# Altium project Remote_Sensor_Unit-v1.0.PrjPcb (part 4 of 4)

## Sheet Controller_Sheet.SchDoc
size 420 x 297 mm; SheetNumber: 5; SheetTotal: 7
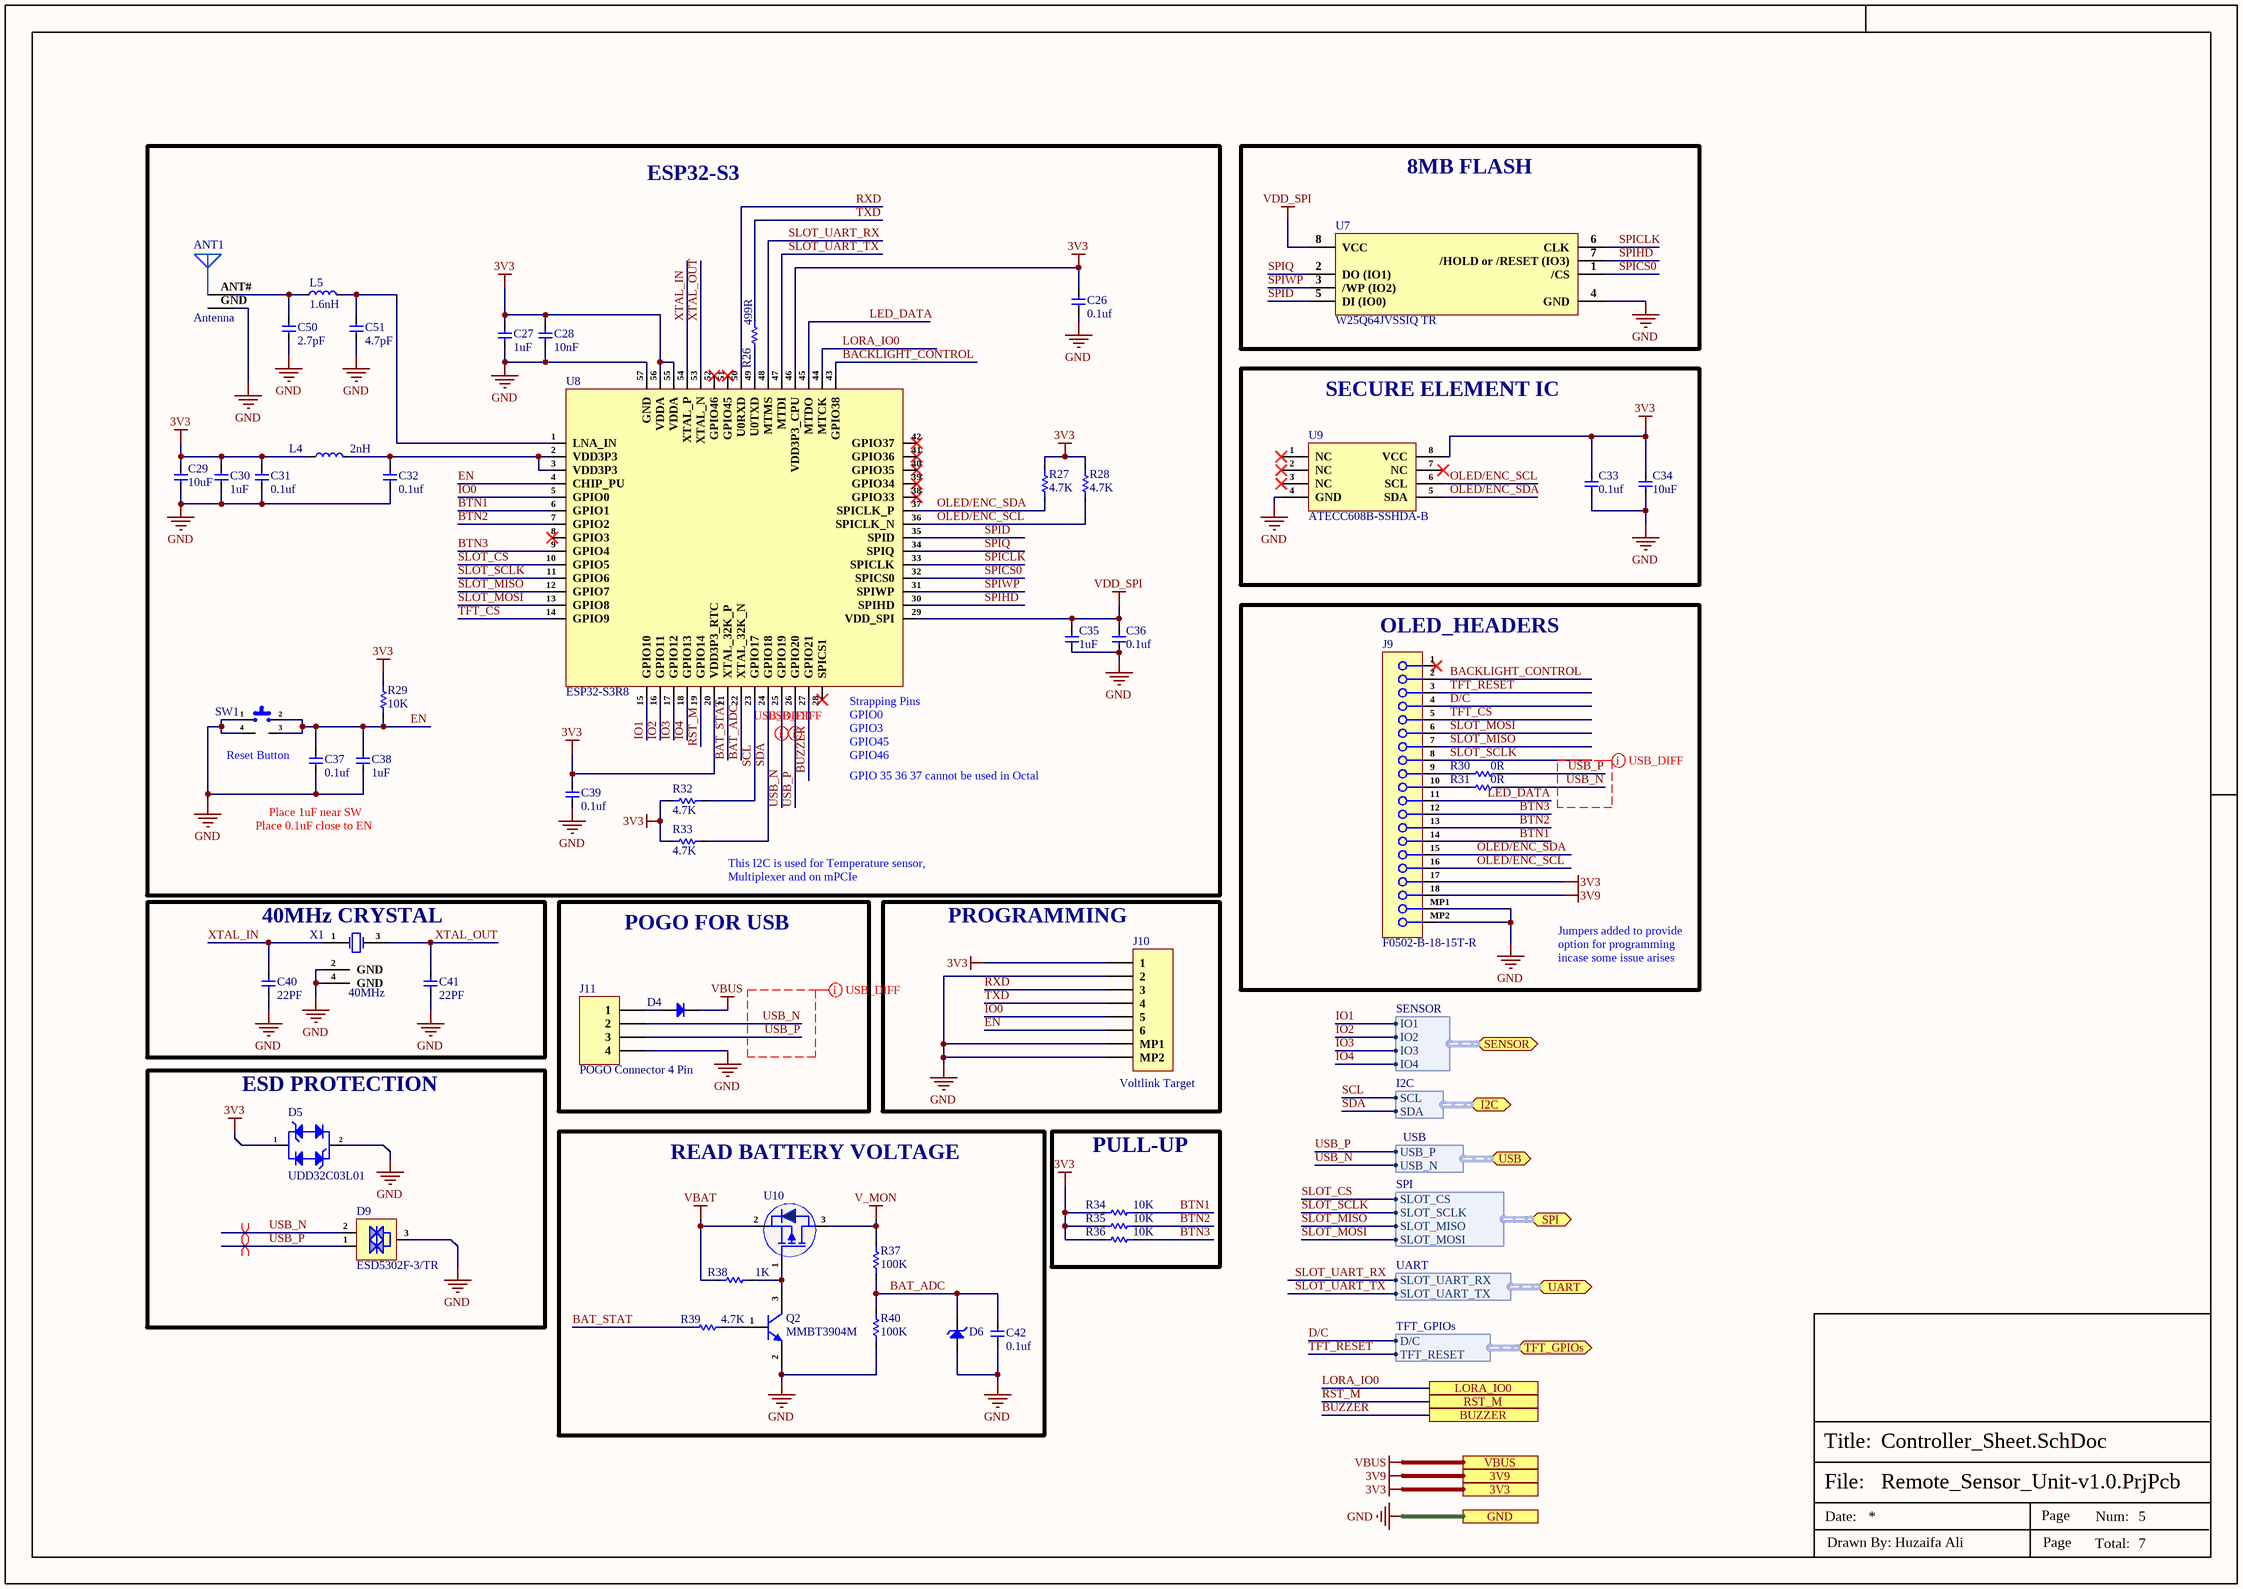
[diagram p6: Controller_Sheet.SchDoc]

### Parts
ANT1  Antenna  [ANT*]  (net tie)
C26  0.1uf  [Cap-0402]
C27  1uF  [Cap-0402]
C28  10nF  [Cap-0402]
C29  10uF  [Cap-0402]
C30  1uF  [Cap-0402]
C31  0.1uf  [Cap-0402]
C32  0.1uf  [Cap-0402]
C33  0.1uf  [Cap-0402]
C34  10uF  [Cap-0402]
C35  1uF  [Cap-0402]
C36  0.1uf  [Cap-0402]
C37  0.1uf  [Cap-0402]
C38  1uF  [Cap-0402]
C39  0.1uf  [Cap-0402]
C40  22PF  [Cap-0402]
C41  22PF  [Cap-0402]
C42  0.1uf  [Cap-0402]
C50  2.7pF  [CAP-0201]
C51  4.7pF  [CAP-0201]
D4  1N4148WS-7-F  [SOD-323]  (value not drawn)
D5  UDD32C03L01  [SOD-323]
D6  MM3Z3V3B  [SOD323F]  (value not drawn)
D9  ESD5302F-3/TR  [Sot-23]
J9  F0502-B-18-15T-R  [F0502-B-18-15T-R]
J10  Voltlink Target  [Voltlink Target]
J11  POGO Connector 4 Pin  [Pogo 4 Pin]
L4  2nH  [IND-0603 (1608 Metric)]
L5  1.6nH  [IND-0603 (1608 Metric)]
Q2  MMBT3904M  [SOT-723]
R26  499R  [Res-0402]
R27  4.7K  [Res-0402]
R28  4.7K  [Res-0402]
R29  10K  [Res-0201]
R30  0R  [Res-0402]
R31  0R  [Res-0402]
R32  4.7K  [Res-0402]
R33  4.7K  [Res-0402]
R34  10K  [Res-0201]
R35  10K  [Res-0201]
R36  10K  [Res-0201]
R37  100K  [Res-0603]
R38  1K  [Res-0201]
R39  4.7K  [Res-0402]
R40  100K  [Res-0603]
SW1  1825027-8  [1825027-8]  (value not drawn)
U7  W25Q64JVSSIQ TR  [SOIC-8 (208 mil)]
U8  ESP32-S3R8  [56-QFN (7x7)]
U9  ATECC608B-SSHDA-B  [SOIC-8]
U10  CSD25501F3  [PicoStar-3]  (value not drawn)
X1  40MHz  [X322540MPB4SI_]

### Blocks framed on the sheet
ESP32-S3: ANT1 C26-C32 C35-C39 C50 C51 L4 L5 R26-R29 R32 R33 SW1 U8
8MB FLASH: U7
SECURE ELEMENT IC: C33 C34 U9
OLED_HEADERS: J9 R30 R31
40MHz CRYSTAL: C40 C41 X1
POGO FOR USB: D4 J11
PROGRAMMING: J10
ESD PROTECTION: D5 D9
READ BATTERY VOLTAGE: C42 D6 Q2 R37-R40 U10
PULL-UP: R34-R36

### Ports
3V3, 3V9, BUZZER, GND, I2C (bidir, harness I2C), LORA_IO0, RST_M, SENSOR (bidir, harness SENSOR), SPI (bidir, harness SPI), TFT_GPIOs (bidir, harness TFT_GPIOs), UART (bidir, harness UART), USB (bidir, harness USB), VBUS

### Harnesses
UART: SLOT_UART_RX, SLOT_UART_TX
SPI: SLOT_CS, SLOT_SCLK, SLOT_MISO, SLOT_MOSI
I2C: SCL, SDA
SENSOR: IO1, IO3, IO2, IO4
USB: USB_P, USB_N
TFT_GPIOs: D/C, TFT_RESET

### Nets
3V3: C26.2 C27.2 C28.2 C29.2 C30.2 C31.2 C33.2 C34.2 C39.2 D5.1 J9.17 J10.1 L4.1 R27.2 R28.2 R29.2 R32.2 R33.2 R34.2 R35.2 R36.2 U8.20(VDD3P3_RTC) U8.46(VDD3P3_CPU) U8.55(VDDA) U8.56(VDDA) U9.8(VCC) ; port 3V3
3V9: J9.18 ; port 3V9
GND: ANT1.GND C26.1 C27.1 C28.1 C29.1 C30.1 C31.1 C32.1 C33.1 C34.1 C35.1 C36.1 C37.1 C38.1 C39.1 C40.1 C41.1 C42.2 C50.1 C51.1 D5.2 D6.1(A) D9.3(GND) J9.MP1 J9.MP2 J10.2 J10.MP1 J10.MP2 J11.4 Q2.2(E) R40.2 SW1.1 SW1.4 U7.4(GND) U8.57(GND) U9.4(GND) X1.2(GND) X1.4(GND) ; port GND
V_MON: R37.1 U10.3(D)
VBAT: R38.1 U10.2(S)
VBUS: D4.1(K) ; port VBUS
VDD_SPI: C35.2 C36.2 U7.8(VCC) U8.29(VDD_SPI)
BACKLIGHT_CONTROL: J9.2 U8.43(GPIO38)
BAT_ADC: C42.1 D6.2(K) R37.2 R40.1 U8.22(XTAL_32K_N)
BAT_STAT: R39.1 U8.21(XTAL_32K_P)
BTN1: J9.14 R34.1 U8.6(GPIO1)
BTN2: J9.13 R35.1 U8.7(GPIO2)
BTN3: J9.12 R36.1 U8.9(GPIO4)
BUZZER: U8.27(GPIO21) ; port BUZZER
D/C: J9.4 ; port TFT_GPIOs.D/C
EN: C37.2 C38.2 J10.6 R29.1 SW1.2 SW1.3 U8.4(CHIP_PU)
IO0: J10.5 U8.5(GPIO0)
IO1: U8.15(GPIO10) ; port SENSOR.IO1
IO2: U8.16(GPIO11) ; port SENSOR.IO2
IO3: U8.17(GPIO12) ; port SENSOR.IO3
IO4: U8.18(GPIO13) ; port SENSOR.IO4
LED_DATA: J9.11 U8.45(MTDO)
LORA_IO0: U8.44(MTCK) ; port LORA_IO0
OLED/ENC_SCL: J9.16 R28.1 U8.36(SPICLK_N) U9.6(SCL)
OLED/ENC_SDA: J9.15 R27.1 U8.37(SPICLK_P) U9.5(SDA)
RST_M: U8.19(GPIO14) ; port RST_M
RXD: J10.3 U8.50(U0RXD)
SCL: R32.1 U8.23(GPIO17) ; port I2C.SCL  [project net I2C.SCL]
SDA: R33.1 U8.24(GPIO18) ; port I2C.SDA  [project net I2C.SDA]
SLOT_CS: U8.10(GPIO5) ; port SPI.SLOT_CS
SLOT_MISO: J9.7 U8.12(GPIO7) ; port SPI.SLOT_MISO
SLOT_MOSI: J9.6 U8.13(GPIO8) ; port SPI.SLOT_MOSI
SLOT_SCLK: J9.8 U8.11(GPIO6) ; port SPI.SLOT_SCLK
SLOT_UART_RX: U8.48(MTMS) ; port UART.SLOT_UART_RX
SLOT_UART_TX: U8.47(MTDI) ; port UART.SLOT_UART_TX
SPICLK: U7.6(CLK) U8.33(SPICLK)
SPICS0: U7.1(/CS) U8.32(SPICS0)
SPID: U7.5(DI_(IO0)) U8.35(SPID)
SPIHD: U7.7(/HOLD_or_/RESET_(IO3)) U8.30(SPIHD)
SPIQ: U7.2(DO_(IO1)) U8.34(SPIQ)
SPIWP: U7.3(/WP_(IO2)) U8.31(SPIWP)
TFT_CS: J9.5 U8.14(GPIO9)
TFT_RESET: J9.3 ; port TFT_GPIOs.TFT_RESET
TXD: J10.4 R26.2
USB_N: D9.2(I/O2) J11.2 R31.2 U8.25(GPIO19) ; port USB.USB_N  [project net USB.USB_N]
USB_P: D9.1(I/O1) J11.3 R30.2 U8.26(GPIO20) ; port USB.USB_P  [project net USB.USB_P]
XTAL_IN: C40.2 U8.54(XTAL_P) X1.1(CRYSTAL)
XTAL_OUT: C41.2 U8.53(XTAL_N) X1.3(CRYSTAL)
NetANT1_ANT#: ANT1.ANT# C50.2 L5.1
NetC32_2: C32.2 L4.2 U8.2(VDD3P3) U8.3(VDD3P3)
NetC51_2: C51.2 L5.2 U8.1(LNA_IN)
NetD4_2: D4.2(A) J11.1
NetJ9_9: J9.9 R30.1
NetJ9_10: J9.10 R31.1
NetQ2_1: Q2.1(B) R39.2
NetQ2_3: Q2.3(C) R38.2 U10.1(G)
NetR26_1: R26.1 U8.49(U0TXD)

Not connected (* = marked no-connect by the designer): J9 1*; U8 8(GPIO3)* 28(SPICS1)* 38(GPIO33)* 39(GPIO34)* 40(GPIO35)* 41(GPIO36)* 42(GPIO37)* 51(GPIO45)* 52(GPIO46)*; U9 1(NC)* 2(NC)* 3(NC)* 7(NC)*

### Layout directives
differential pair; net class USB_DIFF; differential pair class USB_DIFF_Lines; rule Matched Net Lengths [Tolerance = 20mil]; rule Impedance Constraint [Min = 85.00    Max = 95.00    ]: USB.USB_N, USB.USB_P, USB_N, USB_P
differential pair; net class GSM_USB; differential pair class GSM_USB_Lines; rule Impedance Constraint [Min = 88.00    Max = 90.00    ]; rule Matched Net Lengths [Tolerance = 20mil]: USB.USB_N, USB.USB_P

### Notes on the sheet
- Reset Button
- (near U8) Strapping Pins
  GPIO0
  GPIO3
  GPIO45
  GPIO46
- GPIO 35 36 37 cannot be used in Octal PSRAM
- Place 0.1uF close to EN pin
- Place 1uF near SW
- (near R33) This I2C is used for Temperature sensor, Multiplexer and on mPCIe
- Jumpers added to provide option for programming incase some issue arises
- File:
- Title:
- Date:
- Page
- Num:
- Total:
- Drawn By: Huzaifa Ali

### Library data of the parts
C26 C31-C33 C36 C37 C39 C42 = GRM155R62A104KE14D: CAP CER 0.1UF 100V X5R 0402; Manufacturer: Murata; Capacitance: 100nF; Tolerance: 10%; Item Type: Capacitor; Supplier 1: Arrow Electronics; Manufacturer Part Number: GRM155R62A104KE14D; RoHS: Yes; Category: Ceramic Capacitors; Stock 1: 870000; Pricing 1: 10000=0.00500, 20000=0.00410, 30000=0.00390, 50000=0.00370, 100000=0.00300 (USD); Mount: Surface Mount; Case/Package: 0402; Case Code (Metric): 1005; Case Code (Imperial): 0402; Weight: 0.000212oz; Min Operating Temperature: -55°C; Max Operating Temperature: 85°C; Packaging: Tape and Reel; Voltage Rating: 100V; Dielectric: X5R; Termination: SMD/SMT; Voltage Rating (DC): 100V; Package Quantity: 10000; Series: GRM; Length: 0.039inch; Width: 0.02inch; Height: 0.5mm; Thickness: 0.022inch; Reach SVHC Compliant: Yes; Lead Free: Lead Free; RoHS Compliant: Yes; ComponentLink1URL: http://www.farnell.com/datasheets/2079151.pdf?src-supplier=Farnell; ComponentLink1Description: http://www.farnell.com/datasheets/2079151.pdf?src-supplier=Farnell; ComponentLink2URL: http://www.mouser.com/ds/2/281/c02e-2905.pdf?src-supplier=Mouser; ComponentLink2Description: http://www.mouser.com/ds/2/281/c02e-2905.pdf?src-supplier=Mouser; ComponentLink3URL: http://www.farnell.com/datasheets/2079151.pdf?src-supplier=Element14; ComponentLink3Description: http://www.farnell.com/datasheets/2079151.pdf?src-supplier=Element14; ComponentLink4URL: http://search.murata.co.jp/Ceramy/image/img/A01X/G101/ENG/GRM155R62A104KE14-01.pdf?src-supplier=Digi-Key; ComponentLink4Description: http://search.murata.co.jp/Ceramy/image/img/A01X/G101/ENG/GRM155R62A104KE14-01.pdf?src-supplier=Digi-Key; ComponentLink5URL: http://www.farnell.com/datasheets/2079151.pdf?src-supplier=Newark; ComponentLink5Description: http://www.farnell.com/datasheets/2079151.pdf?src-supplier=Newark; Supplier Part Number 1: GRM155R62A104KE14D; LCSC Part Number: C162178
C27 C30 C35 C38 = UMK105CBJ105MV-F: CAP CER 1UF 50V X5R 0402; Manufacturer: Taiyo Yuden; Item Type: Capacitor; Supplier 1: Digi-Key; Manufacturer Part Number: UMK105CBJ105MV-F; Stock 1: 412061; Pricing 1: 1=0.27, 10=0.184, 50=0.1224, 100=0.104, 500=0.07342, 1000=0.06424, 2500=0.06118, 5000=0.05659 (USD); Lead Free: Lead Free; RoHS Compliant: Yes; ComponentLink1URL: http://www.farnell.com/datasheets/2801300.pdf?src-supplier=Newark; ComponentLink1Description: http://www.farnell.com/datasheets/2801300.pdf?src-supplier=Newark; ComponentLink2URL: http://www.farnell.com/datasheets/2801300.pdf?src-supplier=Farnell; ComponentLink2Description: http://www.farnell.com/datasheets/2801300.pdf?src-supplier=Farnell; ComponentLink3URL: https://ds.yuden.co.jp/TYCOMPAS/ut/detail?pn=UMK105CBJ105MV-F &amp;u=M&src-supplier=Digi-Key; ComponentLink3Description: https://ds.yuden.co.jp/TYCOMPAS/ut/detail?pn=UMK105CBJ105MV-F &amp;u=M&src-supplier=Digi-Key; Supplier Part Number 1: 587-6278-1-ND; LCSC Part Number: C2880413
C28 = CC0402KRX7R9BB103: CAP CER 10000PF 50V X7R 0402; Manufacturer: Yageo; Tolerance: 10%; Item Type: Capacitor; Supplier 1: Avnet; Manufacturer Part Number: CC0402KRX7R9BB103; RoHS: Yes; Category: Ceramic Capacitors; Stock 1: 995000; Pricing 1: 10000=0.00178 (USD); Mount: Surface Mount; Case/Package: 0402; Case Code (Imperial): 0402; Case Code (Metric): 1005; Min Operating Temperature: -55°C; Max Operating Temperature: 125°C; Capacitance: 10nF; Dielectric: X7R; Packaging: Tape and Reel; Voltage Rating: 50V; Voltage Rating (DC): 50V; Package Quantity: 1; Termination: SMD/SMT; Resistor Type: Ceramic; Voltage: 50V; Series: CC; Length: 1mm; Width: 0.02inch; Height: 0.5mm; Thickness: 0.022inch; Depth: 0.5mm; Radiation Hardening: No; RoHS Compliant: Yes; Reach SVHC Compliant: Yes; Lead Free: Lead Free; Halogen Free: Halogen Free; ComponentLink1URL: https://datasheet.ciiva.com/11788/0900766b8079c870-11788375.pdf?src-supplier=RSComponents; ComponentLink1Description: https://datasheet.ciiva.com/11788/0900766b8079c870-11788375.pdf?src-supplier=RSComponents; ComponentLink2URL: https://datasheet.ciiva.com/26862/getdatasheetpartid-138248-26862642.pdf?src-supplier=Verical; ComponentLink2Description: https://datasheet.ciiva.com/26862/getdatasheetpartid-138248-26862642.pdf?src-supplier=Verical; ComponentLink3URL: https://datasheet.ciiva.com/7978/1489800-7978093.pdf?src-supplier=Element14; ComponentLink3Description: https://datasheet.ciiva.com/7978/1489800-7978093.pdf?src-supplier=Element14; ComponentLink4URL: https://datasheet.ciiva.com/28450/1489800-28450377.pdf?src-supplier=Element14; ComponentLink4Description: https://datasheet.ciiva.com/28450/1489800-28450377.pdf?src-supplier=Element14; ComponentLink5URL: https://datasheet.ciiva.com/176/mlccorderingcode-176349.pdf?src-supplier=Digi-Key; ComponentLink5Description: https://datasheet.ciiva.com/176/mlccorderingcode-176349.pdf?src-supplier=Digi-Key; ComponentLink6URL: https://datasheet.ciiva.com/176/mlccorderingcode-176348.pdf?src-supplier=Digi-Key; ComponentLink6Description: https://datasheet.ciiva.com/176/mlccorderingcode-176348.pdf?src-supplier=Digi-Key; ComponentLink7URL: https://datasheet.ciiva.com/176/mlccorderingcode-176350.pdf?src-supplier=Digi-Key; ComponentLink7Description: https://datasheet.ciiva.com/176/mlccorderingcode-176350.pdf?src-supplier=Digi-Key; Supplier Part Number 1: CC0402KRX7R9BB103; LCSC Part Number: C60133
C29 C34 = CL05A106MP5NUNC: CAP CER 10UF 10V X5R 0402; Manufacturer: Samsung; Tolerance: 20%; Item Type: Capacitor; Supplier 1: Avnet; Manufacturer Part Number: CL05A106MP5NUNC; RoHS: Yes; Category: Ceramic Capacitors; Stock 1: 1729850; Pricing 1: 10000=0.02537 (USD); Mount: Surface Mount; Case/Package: 0402; Case Code (Metric): 1005; Case Code (Imperial): 0402; Contact Plating: Tin; Min Operating Temperature: -55°C; Max Operating Temperature: 85°C; Package Quantity: 1; Packaging: Tape and Reel; Capacitance: 10uF; Voltage Rating: 10V; Dielectric: X5R; Termination: Wraparound; Series: CL; Construction: Flat; Length: 1mm; Width: 0.02inch; Thickness: 0.028inch; Depth: 0.5mm; Radiation Hardening: No; Lead Free: Lead Free; RoHS Compliant: Yes; ComponentLink1URL: https://datasheet.ciiva.com/25721/cl05a106mp5nunc-25721584.pdf?src-supplier=Digi-Key; ComponentLink1Description: https://datasheet.ciiva.com/25721/cl05a106mp5nunc-25721584.pdf?src-supplier=Digi-Key; ComponentLink2URL: https://datasheet.ciiva.com/26838/getdatasheetpartid-745310-26838170.pdf?src-supplier=Verical; ComponentLink2Description: https://datasheet.ciiva.com/26838/getdatasheetpartid-745310-26838170.pdf?src-supplier=Verical; Supplier Part Number 1: CL05A106MP5NUNC; LCSC Part Number: C315248
C40 C41 = CC0402JRNPO9BN220: CAP CER 22PF 50V C0G/NPO 0402; Manufacturer: Yageo; Dielectric Material: Ceramic; Tolerance: 5%; Dielectric: C0G; Temperature Coefficient: 30ppm/°C; Insulation Resistance: 100GR; Item Type: Capacitor; Supplier 1: Future Electronics; Manufacturer Part Number: CC0402JRNPO9BN220; RoHS: Yes; Category: Ceramic Capacitors; Stock 1: 200000; Pricing 1: 10000=0.00220, 40000=0.00210, 150000=0.00200, 400000=0.00190, 1000000=0.00180 (USD); Mounting Technology: Surface Mount; Case/Package: 0402; Pins: 2; Case Code (Metric): 1005; Case Code (Imperial): 0402; Min Operating Temperature: -55°C; Max Operating Temperature: 125°C; Value: 22pF; Voltage Rating: 50V; Packaging: Tape and Reel; Package Quantity: 1; Voltage Rating (DC): 50V; Termination: SMD/SMT; Resistor Type: Ceramic; Voltage: 50V; Series: CC; Length: 1mm; Width: 0.02inch; Height: 0.5mm; Thickness: 0.022inch; Depth: 0.5mm; Radiation Hardening: No; Reach SVHC Compliant: Yes; Lead Free: Lead Free; RoHS Compliant: Yes; ComponentLink1URL: https://datasheet.ciiva.com/5789/1443161-5789509.pdf?src-supplier=Farnell; ComponentLink1Description: https://datasheet.ciiva.com/5789/1443161-5789509.pdf?src-supplier=Farnell; ComponentLink2URL: https://datasheet.ciiva.com/8033/1443161-8033606.pdf?src-supplier=Element14; ComponentLink2Description: https://datasheet.ciiva.com/8033/1443161-8033606.pdf?src-supplier=Element14; ComponentLink3URL: https://datasheet.ciiva.com/7656/1132289-7656615.pdf?src-supplier=Element14; ComponentLink3Description: https://datasheet.ciiva.com/7656/1132289-7656615.pdf?src-supplier=Element14; ComponentLink4URL: https://datasheet.ciiva.com/8033/1443161-8033607.pdf?src-supplier=Element14; ComponentLink4Description: https://datasheet.ciiva.com/8033/1443161-8033607.pdf?src-supplier=Element14; ComponentLink5URL: https://datasheet.ciiva.com/8033/1443161-8033605.pdf?src-supplier=Element14; ComponentLink5Description: https://datasheet.ciiva.com/8033/1443161-8033605.pdf?src-supplier=Element14; ComponentLink6URL: https://datasheet.ciiva.com/143/mlccorderingcode-143987.pdf?src-supplier=Digi-Key; ComponentLink6Description: https://datasheet.ciiva.com/143/mlccorderingcode-143987.pdf?src-supplier=Digi-Key; ComponentLink7URL: https://datasheet.ciiva.com/143/mlccorderingcode-143986.pdf?src-supplier=Digi-Key; ComponentLink7Description: https://datasheet.ciiva.com/143/mlccorderingcode-143986.pdf?src-supplier=Digi-Key; ComponentLink8URL: https://datasheet.ciiva.com/143/mlccorderingcode-143988.pdf?src-supplier=Digi-Key; ComponentLink8Description: https://datasheet.ciiva.com/143/mlccorderingcode-143988.pdf?src-supplier=Digi-Key; ComponentLink9URL: https://datasheet.ciiva.com/5425/upy-gp-np0-16v-to-50v-8-5425483.pdf?src-supplier=Mouser; ComponentLink9Description: https://datasheet.ciiva.com/5425/upy-gp-np0-16v-to-50v-8-5425483.pdf?src-supplier=Mouser; ComponentLink10URL: https://datasheet.ciiva.com/15189/getdatasheetpartid-370074-15189117.pdf?src-supplier=Verical; ComponentLink10Description: https://datasheet.ciiva.com/15189/getdatasheetpartid-370074-15189117.pdf?src-supplier=Verical; Supplier Part Number 1: 9105957; LCSC Part Number: C106203
C50 = CC0201CRNPO9BN2R7: CAP CER 2.7PF 50V C0G/NPO 0201; Manufacturer: Yageo; Dielectric: C0G; Item Type: Capacitor; Supplier: Avnet; Supplier Part Number: CC0201CRNPO9BN2R7; Manufacturer Part Number: CC0201CRNPO9BN2R7; RoHS: Yes; Category: Ceramic Capacitors; Stock: 15000; Pricing: 15000=0.0017 (USD); Mounting Technology: Surface Mount; Case/Package: 0201; Case Code (Imperial): 0201; Case Code (Metric): 0603; Weight: 6E-06oz; Min Operating Temperature: -55°C; Max Operating Temperature: 125°C; Value: 2.7pF; Packaging: Tape and Reel; Voltage Rating (DC): 50V; Voltage Rating: 50V; Termination: SMD/SMT; Series: CC; Length: 0.024inch; Width: 0.012inch; Thickness: 0.013inch; RoHS Compliant: Yes; ComponentLink1URL: https://datasheet.ciiva.com/13208/upy-gp-np0-16v-to-50v-8-13208314.pdf?src-supplier=Mouser; ComponentLink1Description: https://datasheet.ciiva.com/13208/upy-gp-np0-16v-to-50v-8-13208314.pdf?src-supplier=Mouser; LCSC Part Number: C325439
C51 = CC0201BRNPO9BN4R7: CAP CER 4.7PF 50V C0G/NPO 0201; Manufacturer: Yageo; Item Type: Capacitor; Supplier: Arrow Electronics; Supplier Part Number: CC0201BRNPO9BN4R7; Manufacturer Part Number: CC0201BRNPO9BN4R7; RoHS: Yes; Category: Ceramic Capacitors; Stock: 210000; Pricing: 15000=0.0023 (USD); Mounting Technology: Surface Mount; Case/Package: 0201; Min Operating Temperature: -55°C; Max Operating Temperature: 125°C; Packaging: Tape and Reel; Value: 4.7pF; Voltage Rating: 50V; Series: CC; Length: 0.024inch; Width: 0.012inch; Thickness: 0.013inch; RoHS Compliant: Yes; ComponentLink1URL: https://www.yageo.com/upload/media/product/productsearch/datasheet/mlcc/UPY-GP_NP0_16V-to-50V_18.pdf?src-supplier=Digi-Key; ComponentLink1Description: https://www.yageo.com/upload/media/product/productsearch/datasheet/mlcc/UPY-GP_NP0_16V-to-50V_18.pdf?src-supplier=Digi-Key; ComponentLink2URL: http://www.yageo.com/documents/recent/UPY-GP_NP0_16V-to-50V_16.pdf?src-supplier=Digi-Key; ComponentLink2Description: http://www.yageo.com/documents/recent/UPY-GP_NP0_16V-to-50V_16.pdf?src-supplier=Digi-Key; LCSC Part Number: C505471
D4 = 1N4148WS-7-F: DIODE GEN PURP 75V 150MA SOD323; Manufacturer: Diodes; Forward Current: 300mA; Reverse Recovery Time: 4ns; Element Configuration: Single; Forward Voltage: 1.25V; Max Reverse Current: 1uA; Peak Non-Repetitive Surge Current: 2A; Power Dissipation: 200mW; Polarity: Standard; Capacitance: 2pF; Supplier 1: Mouser; Manufacturer Part Number: 1N4148WS-7-F; RoHS: Yes; Category: Rectifier Diodes; Pricing 1: 1=0.19000, 10=0.17500, 50=0.17500, 100=0.09600, 500=0.05900, 1000=0.04000, 3000=0.03000, 9000=0.02600, 10000=0.02600, 24000=0.02300, 45000=0.01900 (USD); Mount: Surface Mount; Number of Pins: 2; Weight: 0.000173oz; Contact Plating: Tin,Matte; Min Operating Temperature: -65°C; Max Operating Temperature: 150°C; Max Repetitive Reverse Voltage (Vrrm): 75V; Max Forward Surge Current (Ifsm): 2A; Max Surge Current: 2A; Packaging: Tape and Reel; Recovery Time: 4ns; Package Quantity: 3000; Average Rectified Current: 150mA; Voltage Rating (DC): 75V; Power Rating: 200mW; Current Rating: 150mA; Output Current: 150mA; Voltage: 75V; Max Reverse Voltage (DC): 75V; Series: -; Reverse Recovery Time-Max: 4ns; Length: 1.8mm; Width: 1.4mm; Height: 1mm; Radiation Hardening: No; REACH SVHC: No SVHC; Lead Free: Lead Free; RoHS Compliant: Yes; ComponentLink1URL: https://datasheet.ciiva.com/1179/ds30097-1179355.pdf?src-supplier=Element14; ComponentLink1Description: https://datasheet.ciiva.com/1179/ds30097-1179355.pdf?src-supplier=Element14; ComponentLink2URL: https://datasheet.ciiva.com/8300/ds30097-8300396.pdf?src-supplier=Avnet; ComponentLink2Description: https://datasheet.ciiva.com/8300/ds30097-8300396.pdf?src-supplier=Avnet; ComponentLink3URL: https://datasheet.ciiva.com/16199/ds30097-16199061.pdf?src-supplier=Future+Electronics; ComponentLink3Description: https://datasheet.ciiva.com/16199/ds30097-16199061.pdf?src-supplier=Future+Electronics; ComponentLink4URL: https://datasheet.ciiva.com/911/ds30097-911742.pdf?src-supplier=Digi-Key; ComponentLink4Description: https://datasheet.ciiva.com/911/ds30097-911742.pdf?src-supplier=Digi-Key; ComponentLink5URL: https://datasheet.ciiva.com/911/ds30097-911743.pdf?src-supplier=Digi-Key; ComponentLink5Description: https://datasheet.ciiva.com/911/ds30097-911743.pdf?src-supplier=Digi-Key; ComponentLink6URL: https://datasheet.ciiva.com/911/ds30097-911741.pdf?src-supplier=Digi-Key; ComponentLink6Description: https://datasheet.ciiva.com/911/ds30097-911741.pdf?src-supplier=Digi-Key; Supplier Part Number 1: 621-1N4148WS-F; LCSC Part Number: C60580; Item Type: Diode
D5 = UDD32C03L01: 15V 19A 3.3V 4V Bidirectional SOD-323 ESD Protection Devices ROHS; Manufacturer: Brightking; Item Type: ESD Diode; Manufacturer Part Number: UDD32C03L01; ComponentLink1Description: LCSC; ComponentLink1URL: https://lcsc.com/product-detail/span-style-background-color-ff0-ESD-span-Protection-Devices_Brightking-Elec-TAIWAN-UDD32C03L01_C78439.html; LCSC Part Number: C78439
D6 = MM3Z3V3B: DIODE ZENER 3.3V 200MW SOD323F; Manufacturer: ON Semiconductor / Fairchild; Forward Voltage: 1V; Tolerance: 2%; Impedance: 89R; Max Reverse Leakage Current: 4.5uA; Test Current: 5mA; Element Configuration: Single; Supplier 1: Digi-Key; Manufacturer Part Number: MM3Z3V3B; Stock 1: 473644; Pricing 1: 1=0.22, 10=0.18, 100=0.0956, 500=0.06288, 1000=0.04276 (USD); Mount: Surface Mount; Number of Pins: 2; Weight: 0.0276g; Min Operating Temperature: -65°C; Max Operating Temperature: 150°C; Packaging: Tape and Reel; Package Quantity: 1; Max Power Dissipation: 200mW; Zener Voltage: 3.3V; Voltage Tolerance: 2%; Power Dissipation: 200mW; Working Voltage: 3.3V; Peak Reverse Current: 4.5uA; Length: 1.3mm; Height: 1mm; Width: 1.7mm; Radiation Hardening: No; REACH SVHC: No SVHC; Lead Free: Lead Free; ComponentLink1URL: http://www.onsemi.com/pub/Collateral/MM3Z9V1B-D.pdf?src-supplier=Digi-Key; ComponentLink1Description: http://www.onsemi.com/pub/Collateral/MM3Z9V1B-D.pdf?src-supplier=Digi-Key; ComponentLink2URL: http://www.mouser.com/ds/2/149/MM3Z3V3B-187166.pdf?src-supplier=Mouser; ComponentLink2Description: http://www.mouser.com/ds/2/149/MM3Z3V3B-187166.pdf?src-supplier=Mouser; ComponentLink3URL: https://www.fairchildsemi.com/datasheets/MM/MM3Z9V1B.pdf?src-supplier=Avnet; ComponentLink3Description: https://www.fairchildsemi.com/datasheets/MM/MM3Z9V1B.pdf?src-supplier=Avnet; ComponentLink4URL: http://www.farnell.com/datasheets/1706525.pdf?src-supplier=Element14; ComponentLink4Description: http://www.farnell.com/datasheets/1706525.pdf?src-supplier=Element14; Supplier Part Number 1: MM3Z3V3BCT-ND; LCSC Part Number: C2978865
D9 = ESD5302F-3/TR: 16A 20V 7V 5V@Max Unidirectional SOT-23 TVS ROHS; Manufacturer: WILLSEMI; Item Type: Diode; Manufacturer Part Number: ESD5302F-3/TR; Package: SOT-23; LCSC Part Number: C239643; ComponentLink1Description: LCSC; ComponentLink1URL: https://www.lcsc.com/product-detail/TVS_WILLSEMI-Will-Semicon-ESD5302F-3-TR_C239643.html
J9 = F0502-B-18-15T-R: Clamshell -25℃~+85℃ 18P Bottom Contact Surface Mount 0.5mm SMD,P=0.5mm FFC/FPC Connectors ROHS; Manufacturer: XFCN; Manufacturer Part Number: F0502-B-18-15T-R; Package: SMD,P=0.5mm; LCSC Part Number: C2889974; Item Type: FPC Connector; ComponentLink1Description: LCSC; ComponentLink1URL: https://www.lcsc.com/product-detail/FFC-FPC-Connectors_XFCN-F0502-B-18-15T-R_C2889974.html
J10 = C145963: 1x6P SH 1 1mm 6 SMD,P=1mm Wire To Board / Wire To Wire Connector ROHS; Manufacturer: BOOMELE; Manufacturer Part Number: C145963; Package: SMD,P=1mm; LCSC Part Number: C145963; Item Type: Connector; ComponentLink1Description: LCSC; ComponentLink1URL: https://www.lcsc.com/product-detail/Wire-To-Board-Wire-To-Wire-Connector_BOOMELE-Boom-Precision-Elec-C145963_C145963.html
J11 = POGO Connector 4 Pin: Pogo Pad 2.5mm 4 Pin; Item Type: Pogo Connector; Manufacturer Part Number: POGO Connector 4 Pin
L4 = SDCL1608C2N0STDF: 2nH ±0.3nH 0603 Inductors; Manufacturer: Sunlord; Manufacturer Part Number: SDCL1608C2N0STDF; Footprint: 0603; ComponentLink1Description: LCSC; ComponentLink1URL: https://lcsc.com/product-detail/Inductors-SMD_Sunlord-SDCL1608C2N0STDF_C370234.html; Value: 2nH; LCSC Part Number: C370234
L5 = FHW0603UC1N6KST: 700mA 1.6nH ±10% 40mΩ 0603 Inductors (SMD) ROHS; Manufacturer: FH; Footprint: 0603; Manufacturer Part Number: FHW0603UC1N6KST; Value: 1.6nH; LCSC Part Number: C317978; ComponentLink1Description: LCSC; ComponentLink1URL: https://www.lcsc.com/product-detail/Inductors-SMD_FH-Guangdong-Fenghua-Advanced-Tech-FHW0603UC1N6KST_C317978.html
Q2 = MMBT3904M: 40V 100mW 100@10mA,1V 200mA 300MHz 300mV@50mA,5mA NPN -55℃~+150℃@(Tj) SOT-723 Bipolar Transistors - BJT ROHS; Manufacturer: TECH PUBLIC; Item Type: Mosfet; ComponentLink1Description: LCSC; ComponentLink1URL: https://www.lcsc.com/product-detail/Bipolar-Transistors-BJT_TECH-PUBLIC-MMBT3904M_C2923360.html; Manufacturer Part Number: MMBT3904M; Package: SOT-723; LCSC Part Number: C2923360
R26 = RC0402FR-07499RL: RES 499 OHM 1% 1/16W 0402; Manufacturer: Yageo; Power Rating: 62.5mW; Voltage Rating: 50V; Max Power Dissipation: 63mW; Temperature Coefficient: 100ppm/°C; Supplier 1: Mouser; Manufacturer Part Number: RC0402FR-07499RL; RoHS: Yes; Category: Chip SMD Resistors; Stock 1: 936879; Pricing 1: 1=0.10000, 10=0.01200, 50=0.01200, 100=0.00500, 1000=0.00300, 10000=0.00100 (USD); Case/Package: 0402; Case Code (Metric): 1005; Case Code (Imperial): 0402; Size Code: 0402; Min Operating Temperature: -55°C; Max Operating Temperature: 155°C; Resistance: 499R; Tolerance: 1%; Package Quantity: 1; Packaging: Tape and Reel; Resistor Type: Thick Film; Number of Terminations: 2; Termination: SMD/SMT; Voltage Rating (DC): 50V; Features: Moisture Resistant; Series: RC; Resistance Tolerance: 1%; Construction: Rectangular; Length: 1mm; Width: 0.02inch; Height: 0.016inch; Depth: 0.5mm; RoHS Compliant: Yes; REACH SVHC: No SVHC; Military Standard: Not; Lead Free: Lead Free; ComponentLink1URL: https://datasheet.ciiva.com/2453/pyu-r-int-thick-7-2453539.pdf?src-supplier=Digi-Key; ComponentLink1Description: https://datasheet.ciiva.com/2453/pyu-r-int-thick-7-2453539.pdf?src-supplier=Digi-Key; ComponentLink2URL: https://datasheet.ciiva.com/2453/pyu-r-int-thick-7-2453540.pdf?src-supplier=Digi-Key; ComponentLink2Description: https://datasheet.ciiva.com/2453/pyu-r-int-thick-7-2453540.pdf?src-supplier=Digi-Key; ComponentLink3URL: https://datasheet.ciiva.com/2453/pyu-r-int-thick-7-2453538.pdf?src-supplier=Digi-Key; ComponentLink3Description: https://datasheet.ciiva.com/2453/pyu-r-int-thick-7-2453538.pdf?src-supplier=Digi-Key; Supplier Part Number 1: 603-RC0402FR-07499RL; LCSC Part Number: C137970
R27 R28 R32 R33 R39 = RC0402FR-074K7L: RES 4.7K OHM 1% 1/16W 0402; Manufacturer: Yageo; Voltage Rating (DC): 50V; Power Rating: 62.5mW; Resistance: 4.7kR; Temperature Coefficient: 100ppm/°C; Max Power Dissipation: 63mW; Item Type: Resistor; Supplier 1: Avnet; Manufacturer Part Number: RC0402FR-074K7L; RoHS: Yes; Category: Chip SMD Resistors; Stock 1: 2420000; Pricing 1: 10000=0.00085 (USD); Case/Package: 0402; Number of Pins: 2; Case Code (Imperial): 0402; Case Code (Metric): 1005; Size Code: 0402; Min Operating Temperature: -55°C; Max Operating Temperature: 155°C; Tolerance: 1%; Voltage Rating: 50V; Packaging: Tape and Reel; Resistor Type: Thick Film; Termination: SMD/SMT; Features: Moisture Resistant; Series: RC; Number of Terminations: 2; Resistance Tolerance: 1%; Construction: Rectangular; Length: 1mm; Width: 0.5mm; Height: 0.32mm; Depth: 0.5mm; Height - Seated (Max): 0.016inch; RoHS Compliant: Yes; Reach SVHC Compliant: Yes; Military Standard: Not; Lead Free: Lead Free; ComponentLink1URL: https://datasheet.ciiva.com/22661/1686128-22661342.pdf?src-supplier=Element14; ComponentLink1Description: https://datasheet.ciiva.com/22661/1686128-22661342.pdf?src-supplier=Element14; ComponentLink2URL: https://datasheet.ciiva.com/7850/1018594-7850022.pdf?src-supplier=Element14; ComponentLink2Description: https://datasheet.ciiva.com/7850/1018594-7850022.pdf?src-supplier=Element14; ComponentLink3URL: https://datasheet.ciiva.com/7850/1018594-7850023.pdf?src-supplier=Element14; ComponentLink3Description: https://datasheet.ciiva.com/7850/1018594-7850023.pdf?src-supplier=Element14; ComponentLink4URL: https://datasheet.ciiva.com/15215/getdatasheetpartid-328119-15215035.pdf?src-supplier=Verical; ComponentLink4Description: https://datasheet.ciiva.com/15215/getdatasheetpartid-328119-15215035.pdf?src-supplier=Verical; Supplier Part Number 1: RC0402FR-074K7L; LCSC Part Number: C105871
R29 R34-R36 = RC0201FR-0710KL: RES SMD 10K OHM 1% 1/20W 0201; Manufacturer: Yageo; Item Type: Resistor; Manufacturer Part Number: RC0201FR-0710KL; Package: 0201; ComponentLink7Description: LCSC; ComponentLink7URL: https://www.lcsc.com/product-detail/Chip-Resistor-Surface-Mount_YAGEO-RC0201FR-0710KL_C106225.html; LCSC Part Number: C106225
R30 R31 = RC0402FR-070RL: RES 0 OHM JUMPER 1/16W 0402; Manufacturer: Yageo; Tolerance: 1%; Power Rating: 62.5mW; Voltage Rating: 50V; Temperature Coefficient: 200ppm/°C; Max Power Dissipation: 63mW; Supplier 1: Mouser; Manufacturer Part Number: RC0402FR-070RL; RoHS: Yes; Category: Chip SMD Resistors; Stock 1: 8556842; Pricing 1: 1=0.10000, 10=0.01400, 50=0.01400, 100=0.00600, 1000=0.00300, 5000=0.00200, 10000=0.00100 (USD); Mount: Surface Mount; Case/Package: 0402; Contact Plating: Tin,Matte; Case Code (Imperial): 0402; Case Code (Metric): 1005; Size Code: 0402; Min Operating Temperature: -55°C; Max Operating Temperature: 155°C; Resistance: 0R; Resistor Type: Thick Film; Packaging: Tape and Reel; Termination: SMD/SMT; Features: Moisture Resistant; Series: RC; Number of Terminations: 2; Length: 1mm; Width: 0.5mm; Height: 0.35mm; Radiation Hardening: No; Lead Free: Lead Free; RoHS Compliant: Yes; ComponentLink1URL: https://datasheet.ciiva.com/8896/pyu-rc0402-51-rohs-l-6-8896149.pdf?src-supplier=Avnet; ComponentLink1Description: https://datasheet.ciiva.com/8896/pyu-rc0402-51-rohs-l-6-8896149.pdf?src-supplier=Avnet; ComponentLink2URL: https://datasheet.ciiva.com/16790/pyu-rc0402-51-rohs-l-6-r-16790444.pdf?src-supplier=Future+Electronics; ComponentLink2Description: https://datasheet.ciiva.com/16790/pyu-rc0402-51-rohs-l-6-r-16790444.pdf?src-supplier=Future+Electronics; Supplier Part Number 1: 603-RC0402FR-070RL; LCSC Part Number: C106231
R37 R40 = RT0603BRD07100KL: RES SMD 100K OHM 0.1% 1/10W 0603; Manufacturer: Yageo; Resistance: 100kR; Temperature Coefficient: 25ppm/°C; Voltage Rating (DC): 75V; Power Rating: 100mW; Item Type: Resistor; Supplier 1: Digi-Key; Manufacturer Part Number: RT0603BRD07100KL; Stock 1: 53395; Pricing 1: 1=0.39, 10=0.332, 100=0.1298, 1000=0.05435, 2500=0.04982 (USD); Mount: Surface Mount; Case/Package: 0603; Case Code (Imperial): 0603; Case Code (Metric): 1608; Min Operating Temperature: -55°C; Max Operating Temperature: 125°C; Tolerance: 0.1%; Composition: Thin Film; Packaging: Tape and Reel; Voltage Rating: 75V; Package Quantity: 5000; Termination: SMD/SMT; Number of Terminations: 2; Military Standard: Not; Max Power Dissipation: 100mW; Working Voltage: 75V; Features: Moisture Resistant; Length: 1.6mm; Height: 0.022inch; Width: 0.031inch; Depth: 0.8mm; Lead Free: Lead Free; ComponentLink1URL: http://documents.rs-components.com/techlib://itc_doclist_GB.htm?stockno=6174810&src-supplier=RSComponents; ComponentLink1Description: http://documents.rs-components.com/techlib://itc_doclist_GB.htm?stockno=6174810&src-supplier=RSComponents; Supplier Part Number 1: YAG1235CT-ND; LCSC Part Number: C122538
R38 = RC0201FR-071KP: RES 1K OHM 1% 1/20W 0201; Manufacturer: Yageo; Supplier 1: Digi-Key; Manufacturer Part Number: RC0201FR-071KP; RoHS: Yes; Stock 1: 4800; Pricing 1: 1=0.11000, 10=0.10200, 100=0.03940, 1000=0.01734, 2500=0.01497, 5000=0.01340 (USD); RoHS Compliant: Yes; Supplier Part Number 1: 13-RC0201FR-071KPCT-ND; LCSC Part Number: C3953443
SW1 = 1825027-8: 50mA Lying SPST 24V Plugin Tactile Switches ROHS; Manufacturer: TE Connectivity; Supplier 1: Arrow Electronics; Manufacturer Part Number: 1825027-8; RoHS: Yes; Category: Pushbutton Switches; Stock 1: 178529; Pricing 1: 1=0.13800, 10=0.13370, 25=0.12590, 100=0.10940, 250=0.10570, 500=0.09520, 1000=0.07320, 2500=0.07250, 5000=0.06250 (USD); ComponentLink1URL: https://datasheet.ciiva.com/30072/eng-cd-1825027-f-30072833.pdf?src-supplier=Onlinecomponents.com; ComponentLink1Description: https://datasheet.ciiva.com/30072/eng-cd-1825027-f-30072833.pdf?src-supplier=Onlinecomponents.com; ComponentLink2URL: https://datasheet.ciiva.com/16393/1825027-8-16393346.pdf?src-supplier=Future+Electronics; ComponentLink2Description: https://datasheet.ciiva.com/16393/1825027-8-16393346.pdf?src-supplier=Future+Electronics; ComponentLink3URL: https://datasheet.ciiva.com/8164/eng-cd-1825027-g4-8164921.pdf?src-supplier=Avnet; ComponentLink3Description: https://datasheet.ciiva.com/8164/eng-cd-1825027-g4-8164921.pdf?src-supplier=Avnet; Supplier Part Number 1: 1825027-8; Item Type: Tactile Switch
U7 = W25Q64JVSSIQ TR: IC FLASH 64M SPI 133MHZ 8SOIC; Manufacturer: Winbond; Memory Format: FLASH,NOR; Interface: SPI,Serial; Supplier 1: Arrow Electronics; Manufacturer Part Number: W25Q64JVSSIQ TR; RoHS: Yes; Category: Memory; Stock 1: 56000; Pricing 1: 2000=0.8199, 4000=0.7715, 6000=0.7637, 10000=0.7635 (USD); Case/Package: SOIC; Min Operating Temperature: -40°C; Max Operating Temperature: 85°C; Packaging: Tape and Reel; Series: SpiFlash®; ComponentLink1URL: http://www.winbond.com/resource-files/w25q64jv%20spi%20%20%20revc%2006032016%20kms.pdf?src-supplier=Digi-Key; ComponentLink1Description: http://www.winbond.com/resource-files/w25q64jv%20spi%20%20%20revc%2006032016%20kms.pdf?src-supplier=Digi-Key; ComponentLink2URL: http://www.winbond.com/resource-files/w25q64jv%20revj%2003272018%20plus.pdf?src-supplier=Digi-Key; ComponentLink2Description: http://www.winbond.com/resource-files/w25q64jv%20revj%2003272018%20plus.pdf?src-supplier=Digi-Key; Supplier Part Number 1: W25Q64JVSSIQ TR; LCSC Part Number: C179171; Item Type: IC
U8 = ESP32-S3R8: SMD IC ESP32-S3R8, DUAL-CORE MCU; Manufacturer: Espressif Systems; Supplier 1: Mouser; Manufacturer Part Number: ESP32-S3R8; RoHS: No; Category: RF Receivers, Transceivers; Stock 1: 2366; Pricing 1: 1=2.46, 10=2.46, 50=2.46, 100=2.46, 1000=2.46, 10000=2.46 (USD); Supplier Part Number 1: 356-ESP32-S3R8; Item Type: IC
U9 = ATECC608B-SSHDA-B: IC AUTHENTICATION CHIP 8SOIC; Manufacturer: Microchip; Supplier 1: Rs; Manufacturer Part Number: ATECC608B-SSHDA-B; RoHS: Yes; Category: Interface ICs; Stock 1: 590; Pricing 1: 20=0.758, 50=0.704, 80=0.691 (GBP); Supplier Part Number 1: 2368834P; ComponentLink1Description: LCSC; ComponentLink1URL: https://www.lcsc.com/product-detail/Security-Verification-Encryption-ICs_Microchip-Tech-ATECC608B-SSHDA-B_C5444784.html; LCSC Part Number: C5444784; Item Type: IC
U10 = CSD25501F3: MOSFET P-CH 20V 3.6A 3LGA; Manufacturer: Texas Instruments; Element Configuration: Single; Rds On Max: 76mR; Input Capacitance: 385pF; Max Power Dissipation: 500mW; Item Type: IC; Supplier: Mouser; Supplier Part Number: 595-CSD25501F3; Manufacturer Part Number: CSD25501F3; RoHS: Yes; Category: Integrated Circuits (ICs); Stock: 42227; Pricing: 1=0.45, 10=0.34, 50=0.34, 100=0.212, 1000=0.112, 10000=0.086 (USD); Mounting Technology: Surface Mount; Case/Package: LGA; Pins: 3; Min Operating Temperature: -55°C; Max Operating Temperature: 150°C; Packaging: Cut Tape; Drain to Source Voltage (Vdss): 20V; Continuous Drain Current (ID): 3.6A; Series: FemtoFET™; RoHS Compliant: Yes; ComponentLink1URL: http://www.ti.com/lit/ds/symlink/csd25501f3.pdf?src-supplier=Digi-Key; ComponentLink1Description: http://www.ti.com/lit/ds/symlink/csd25501f3.pdf?src-supplier=Digi-Key; ComponentLink2URL: http://www.ti.com/general/docs/suppproductinfo.tsp?distId=10&amp;gotoUrl=http%3A%2F%2Fwww.ti.com%2Flit%2Fgpn%2Fcsd25501f3&src-supplier=Digi-Key; ComponentLink2Description: http://www.ti.com/general/docs/suppproductinfo.tsp?distId=10&amp;gotoUrl=http%3A%2F%2Fwww.ti.com%2Flit%2Fgpn%2Fcsd25501f3&src-supplier=Digi-Key; LCSC Part Number: C2872196
X1 = X322540MPB4SI: 40MHz SMD Crystal Resonator 15pF SMD3225-4P Crystals ROHS; Manufacturer: Yangxing Tech; Manufacturer Part Number: X322540MPB4SI; Value: 40MHZ; LCSC Part Number: C9010; ComponentLink1Description: LCSC; ComponentLink1URL: https://www.lcsc.com/product-detail/Crystals_Yangxing-Tech-X322540MPB4SI_C9010.html; Item Type: Crystal

## Nets that join several sheets
3V3: Connector_Sheet (J3.2 J4.2 J6.2 J7.2), Power_Sheet2 (6 pins), mPCIe_Connector_Sheet (J12.6 J12.24 J12.52), Relay_Buzzer_Temp_Humd_Sheet (16 pins), Controller_Sheet (26 pins)
3V9: Power_Sheet2 (9 pins), mPCIe_Connector_Sheet (J12.2), Controller_Sheet (J9.18)
5V_POE: Power_Sheet1 (D3.2 P1.1 Q1.1 R22.2), mPCIe_Connector_Sheet (J12.46 J12.48)
5V_USB: Connector_Sheet (FB1.2), Power_Sheet1 (P2.1 Q1.3)
GND: Connector_Sheet (13 pins), Power_Sheet1 (17 pins), Power_Sheet2 (16 pins), mPCIe_Connector_Sheet (24 pins), Relay_Buzzer_Temp_Humd_Sheet (14 pins), Controller_Sheet (38 pins)
VBAT: Connector_Sheet (J8.2), Power_Sheet1 (10 pins), Controller_Sheet (R38.1 U10.2)
VBUS: Power_Sheet1 (14 pins), Power_Sheet2 (7 pins), Controller_Sheet (D4.1)
BUZZER: Relay_Buzzer_Temp_Humd_Sheet (R44.1), Controller_Sheet (U8.27)
D/C: Relay_Buzzer_Temp_Humd_Sheet (U12.4), Controller_Sheet (J9.4)
DCDC_POK: mPCIe_Connector_Sheet (J12.8), Relay_Buzzer_Temp_Humd_Sheet (U12.1)
GSM/W5500/LORA_RST: mPCIe_Connector_Sheet (J12.7), Relay_Buzzer_Temp_Humd_Sheet (U12.26)
GSM/W5500_PWR_EN: mPCIe_Connector_Sheet (J12.1), Relay_Buzzer_Temp_Humd_Sheet (U12.25)
I2C.SCL: mPCIe_Connector_Sheet (J12.30), Relay_Buzzer_Temp_Humd_Sheet (U11.6 U12.12 U14.4), Controller_Sheet (R32.1 U8.23)
I2C.SDA: mPCIe_Connector_Sheet (J12.32), Relay_Buzzer_Temp_Humd_Sheet (U11.1 U12.13 U14.3), Controller_Sheet (R33.1 U8.24)
IN_1: Connector_Sheet (J2.2), Relay_Buzzer_Temp_Humd_Sheet (K1.1)
IN_2: Connector_Sheet (J5.2), Relay_Buzzer_Temp_Humd_Sheet (K2.1)
IO1: Connector_Sheet (J3.4), Controller_Sheet (U8.15)
IO2: Connector_Sheet (J6.4), Controller_Sheet (U8.16)
IO3: Connector_Sheet (J4.4), Controller_Sheet (U8.17)
IO4: Connector_Sheet (J7.4), Controller_Sheet (U8.18)
LORA_IO0: mPCIe_Connector_Sheet (J12.10), Controller_Sheet (U8.44)
NC_1: Connector_Sheet (J2.1), Relay_Buzzer_Temp_Humd_Sheet (K1.3)
NC_2: Connector_Sheet (J5.1), Relay_Buzzer_Temp_Humd_Sheet (K2.3)
NO_1: Connector_Sheet (J2.3), Relay_Buzzer_Temp_Humd_Sheet (K1.2)
NO_2: Connector_Sheet (J5.3), Relay_Buzzer_Temp_Humd_Sheet (K2.2)
RST_M: Relay_Buzzer_Temp_Humd_Sheet (R43.1 U12.18), Controller_Sheet (U8.19)
SLOT_CS: mPCIe_Connector_Sheet (J12.37), Controller_Sheet (U8.10)
SLOT_MISO: mPCIe_Connector_Sheet (J12.41), Controller_Sheet (J9.7 U8.12)
SLOT_MOSI: mPCIe_Connector_Sheet (J12.43), Controller_Sheet (J9.6 U8.13)
SLOT_SCLK: mPCIe_Connector_Sheet (J12.39), Controller_Sheet (J9.8 U8.11)
SLOT_TYPE0: mPCIe_Connector_Sheet (J12.3), Relay_Buzzer_Temp_Humd_Sheet (U12.21)
SLOT_TYPE1: mPCIe_Connector_Sheet (J12.5), Relay_Buzzer_Temp_Humd_Sheet (U12.22)
SLOT_TYPE2: mPCIe_Connector_Sheet (J12.31), Relay_Buzzer_Temp_Humd_Sheet (U12.23)
SLOT_TYPE3: mPCIe_Connector_Sheet (J12.33), Relay_Buzzer_Temp_Humd_Sheet (U12.24)
SLOT_UART_RX: mPCIe_Connector_Sheet (J12.11), Controller_Sheet (U8.48)
SLOT_UART_TX: mPCIe_Connector_Sheet (J12.13), Controller_Sheet (U8.47)
TFT_RESET: Relay_Buzzer_Temp_Humd_Sheet (U12.5), Controller_Sheet (J9.3)
USB.USB_N: Connector_Sheet (D10.2 R4.2), mPCIe_Connector_Sheet (R45.2), Controller_Sheet (D9.2 J11.2 R31.2 U8.25)
USB.USB_P: Connector_Sheet (D10.1 R3.2), mPCIe_Connector_Sheet (R46.2), Controller_Sheet (D9.1 J11.3 R30.2 U8.26)
W5500_INT: mPCIe_Connector_Sheet (J12.45), Relay_Buzzer_Temp_Humd_Sheet (U12.27)